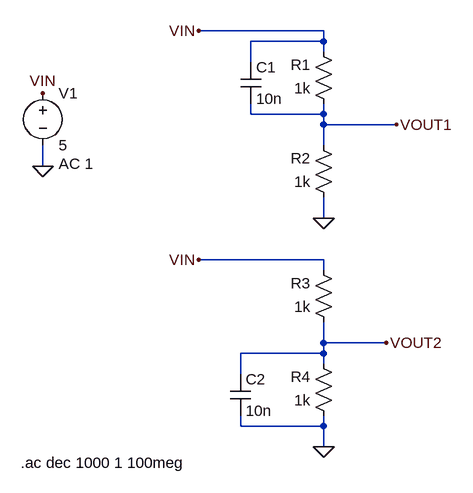
[diagram p0: schematic voltage_divider_with_cap.asc]
voltage_divider_with_cap.asc, the LTspice schematic file:
Version 4
SHEET 1 880 696
WIRE 240 16 48 16
WIRE 240 32 240 16
WIRE 240 32 128 32
WIRE 240 48 240 32
WIRE 128 64 128 32
WIRE 128 144 128 128
WIRE 240 144 240 128
WIRE 240 144 128 144
WIRE 240 160 240 144
WIRE 352 160 240 160
WIRE 240 192 240 160
WIRE -192 224 -192 192
WIRE 240 304 240 272
WIRE 240 368 48 368
WIRE 240 384 240 368
WIRE 240 496 240 464
WIRE 336 496 240 496
WIRE 240 512 240 496
WIRE 240 512 112 512
WIRE 240 528 240 512
WIRE 112 544 112 512
WIRE 112 624 112 608
WIRE 240 624 240 608
WIRE 240 624 112 624
WIRE 240 656 240 624
FLAG 240 656 0
FLAG 240 304 0
FLAG -192 224 0
FLAG -192 112 VIN
FLAG 48 16 VIN
FLAG 48 368 VIN
FLAG 352 160 VOUT1
FLAG 336 496 VOUT2
SYMBOL res 256 144 R180
WINDOW 0 36 76 Left 2
WINDOW 3 36 40 Left 2
SYMATTR InstName R1
SYMATTR Value 1k
SYMBOL res 256 288 R180
WINDOW 0 36 76 Left 2
WINDOW 3 36 40 Left 2
SYMATTR InstName R2
SYMATTR Value 1k
SYMBOL res 256 480 R180
WINDOW 0 36 76 Left 2
WINDOW 3 36 40 Left 2
SYMATTR InstName R3
SYMATTR Value 1k
SYMBOL res 256 624 R180
WINDOW 0 36 76 Left 2
WINDOW 3 36 40 Left 2
SYMATTR InstName R4
SYMATTR Value 1k
SYMBOL cap 112 64 R0
SYMATTR InstName C1
SYMATTR Value 10n
SYMBOL cap 96 544 R0
SYMATTR InstName C2
SYMATTR Value 10n
SYMBOL voltage -192 96 R0
WINDOW 123 24 124 Left 2
WINDOW 39 0 0 Left 0
SYMATTR InstName V1
SYMATTR Value 5
SYMATTR Value2 AC 1
TEXT -226 680 Left 2 !.ac dec 1000 1 100meg

The netlist it stands for:
* voltage_divider_with_cap.asc
R1 VOUT1 VIN 1k
R2 0 VOUT1 1k
R3 VOUT2 VIN 1k
R4 0 VOUT2 1k
C1 VIN VOUT1 10n
C2 VOUT2 0 10n
V1 VIN 0 5 AC 1
.ac dec 1000 1 100meg
.backanno
.end